# Altium project Starchenko_Yalynka.PrjPcb
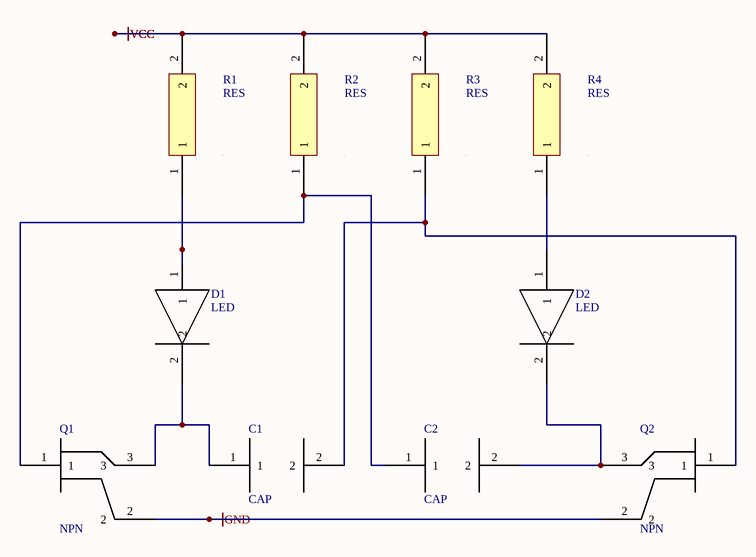
[diagram p0: Yalynka.SchDoc]
1 sheet, 10 parts. Net scope: global (net labels, ports and power ports of the same name join across sheets).
Board file: Yalynka.PcbDoc

## Sheet Yalynka.SchDoc
size A4; SheetNumber: 1; SheetTotal: 1

### Parts
C1  CAP  [CAP_1206]
C2  CAP  [CAP_1206]
D1  LED  [LED_1206]
D2  LED  [LED_1206]
Q1  NPN  [SOT23]
Q2  NPN  [SOT23]
R1  RES  [RES_1206]
R2  RES  [RES_1206]
R3  RES  [RES_1206]
R4  RES  [RES_1206]

### Nets
GND: Q1.2 Q2.2
VCC: R1.2 R2.2 R3.2 R4.2
NetC1_1: C1.1 D1.2 Q1.3
NetC1_2: C1.2 Q2.1 R3.1
NetC2_1: C2.1 Q1.1 R2.1
NetC2_2: C2.2 D2.2 Q2.3
NetD1_1: D1.1 R1.1
NetD2_1: D2.1 R4.1